# Altium schematic sheet Top-Sheet.SchDoc
size 420 x 297 mm; SheetNumber: 1; SheetTotal: 5
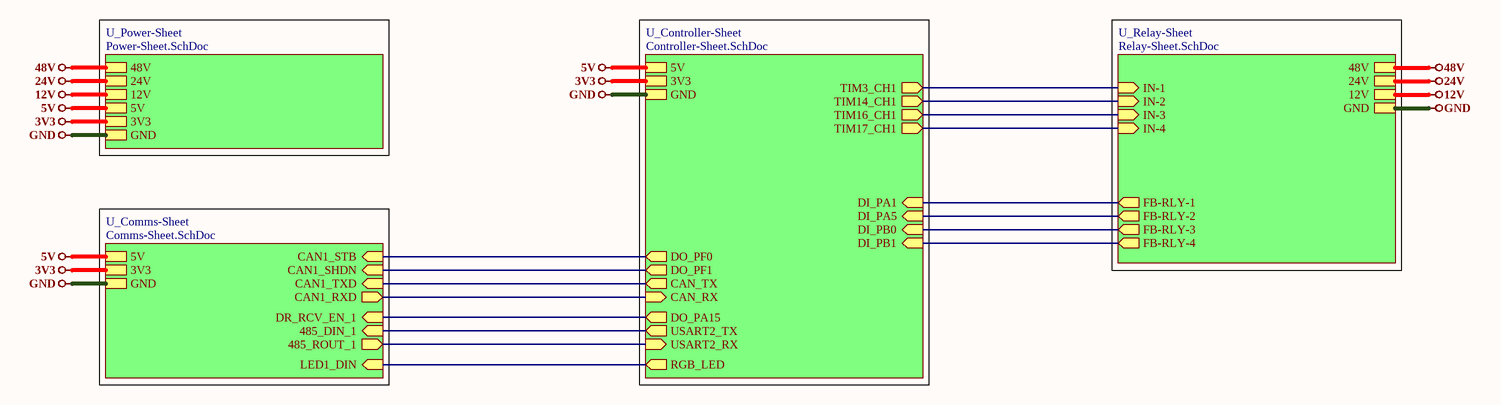
[diagram p0: Top-Sheet.SchDoc]

## Sub-sheets
U_Comms-Sheet = Comms-Sheet.SchDoc: CAN1_STB (in), CAN1_TXD (in), CAN1_RXD (out), CAN1_SHDN (in), LED1_DIN (in), DR_RCV_EN_1 (in), 485_ROUT_1 (out), 485_DIN_1 (in), GND, 3V3, 5V
U_Controller-Sheet = Controller-Sheet.SchDoc: GND, 3V3, 5V, CAN_RX (in), CAN_TX (out), USART2_RX (in), USART2_TX (out), TIM14_CH1 (out), TIM16_CH1 (out), TIM17_CH1 (out), TIM3_CH1 (out), RGB_LED (out), DI_PA5 (in), DI_PB0 (in), DI_PB1 (in), DO_PA15 (out), DO_PF0 (out), DO_PF1 (out), DI_PA1 (in)
U_Power-Sheet = Power-Sheet.SchDoc: GND, 3V3, 5V, 24V, 12V, 48V
U_Relay-Sheet = Relay-Sheet.SchDoc: GND, 24V, 12V, 48V, IN-1 (in), IN-2 (in), IN-3 (in), IN-4 (in), FB-RLY-1 (out), FB-RLY-2 (out), FB-RLY-3 (out), FB-RLY-4 (out)

## Nets
3V3: sheet U_Power-Sheet/3V3, sheet U_Controller-Sheet/3V3, sheet U_Comms-Sheet/3V3
5V: sheet U_Power-Sheet/5V, sheet U_Controller-Sheet/5V, sheet U_Comms-Sheet/5V
12V: sheet U_Power-Sheet/12V, sheet U_Relay-Sheet/12V
24V: sheet U_Power-Sheet/24V, sheet U_Relay-Sheet/24V
48V: sheet U_Power-Sheet/48V, sheet U_Relay-Sheet/48V
GND: sheet U_Power-Sheet/GND, sheet U_Controller-Sheet/GND, sheet U_Relay-Sheet/GND, sheet U_Comms-Sheet/GND
(unnamed): sheet U_Controller-Sheet/CAN_RX, sheet U_Comms-Sheet/CAN1_RXD
(unnamed): sheet U_Controller-Sheet/CAN_TX, sheet U_Comms-Sheet/CAN1_TXD
(unnamed): sheet U_Controller-Sheet/USART2_RX, sheet U_Comms-Sheet/485_ROUT_1
(unnamed): sheet U_Controller-Sheet/USART2_TX, sheet U_Comms-Sheet/485_DIN_1
(unnamed): sheet U_Controller-Sheet/TIM14_CH1, sheet U_Relay-Sheet/IN-2
(unnamed): sheet U_Controller-Sheet/TIM16_CH1, sheet U_Relay-Sheet/IN-3
(unnamed): sheet U_Controller-Sheet/TIM17_CH1, sheet U_Relay-Sheet/IN-4
(unnamed): sheet U_Controller-Sheet/TIM3_CH1, sheet U_Relay-Sheet/IN-1
(unnamed): sheet U_Controller-Sheet/RGB_LED, sheet U_Comms-Sheet/LED1_DIN
(unnamed): sheet U_Controller-Sheet/DI_PA5, sheet U_Relay-Sheet/FB-RLY-2
(unnamed): sheet U_Controller-Sheet/DI_PB0, sheet U_Relay-Sheet/FB-RLY-3
(unnamed): sheet U_Controller-Sheet/DI_PB1, sheet U_Relay-Sheet/FB-RLY-4
(unnamed): sheet U_Controller-Sheet/DO_PA15, sheet U_Comms-Sheet/DR_RCV_EN_1
(unnamed): sheet U_Controller-Sheet/DO_PF0, sheet U_Comms-Sheet/CAN1_STB
(unnamed): sheet U_Controller-Sheet/DO_PF1, sheet U_Comms-Sheet/CAN1_SHDN
(unnamed): sheet U_Controller-Sheet/DI_PA1, sheet U_Relay-Sheet/FB-RLY-1

## Notes on the sheet
- File:
- Title:
- Date:
- Page
- Num:
- Total:
- Drawn By: Huzaifa Ali